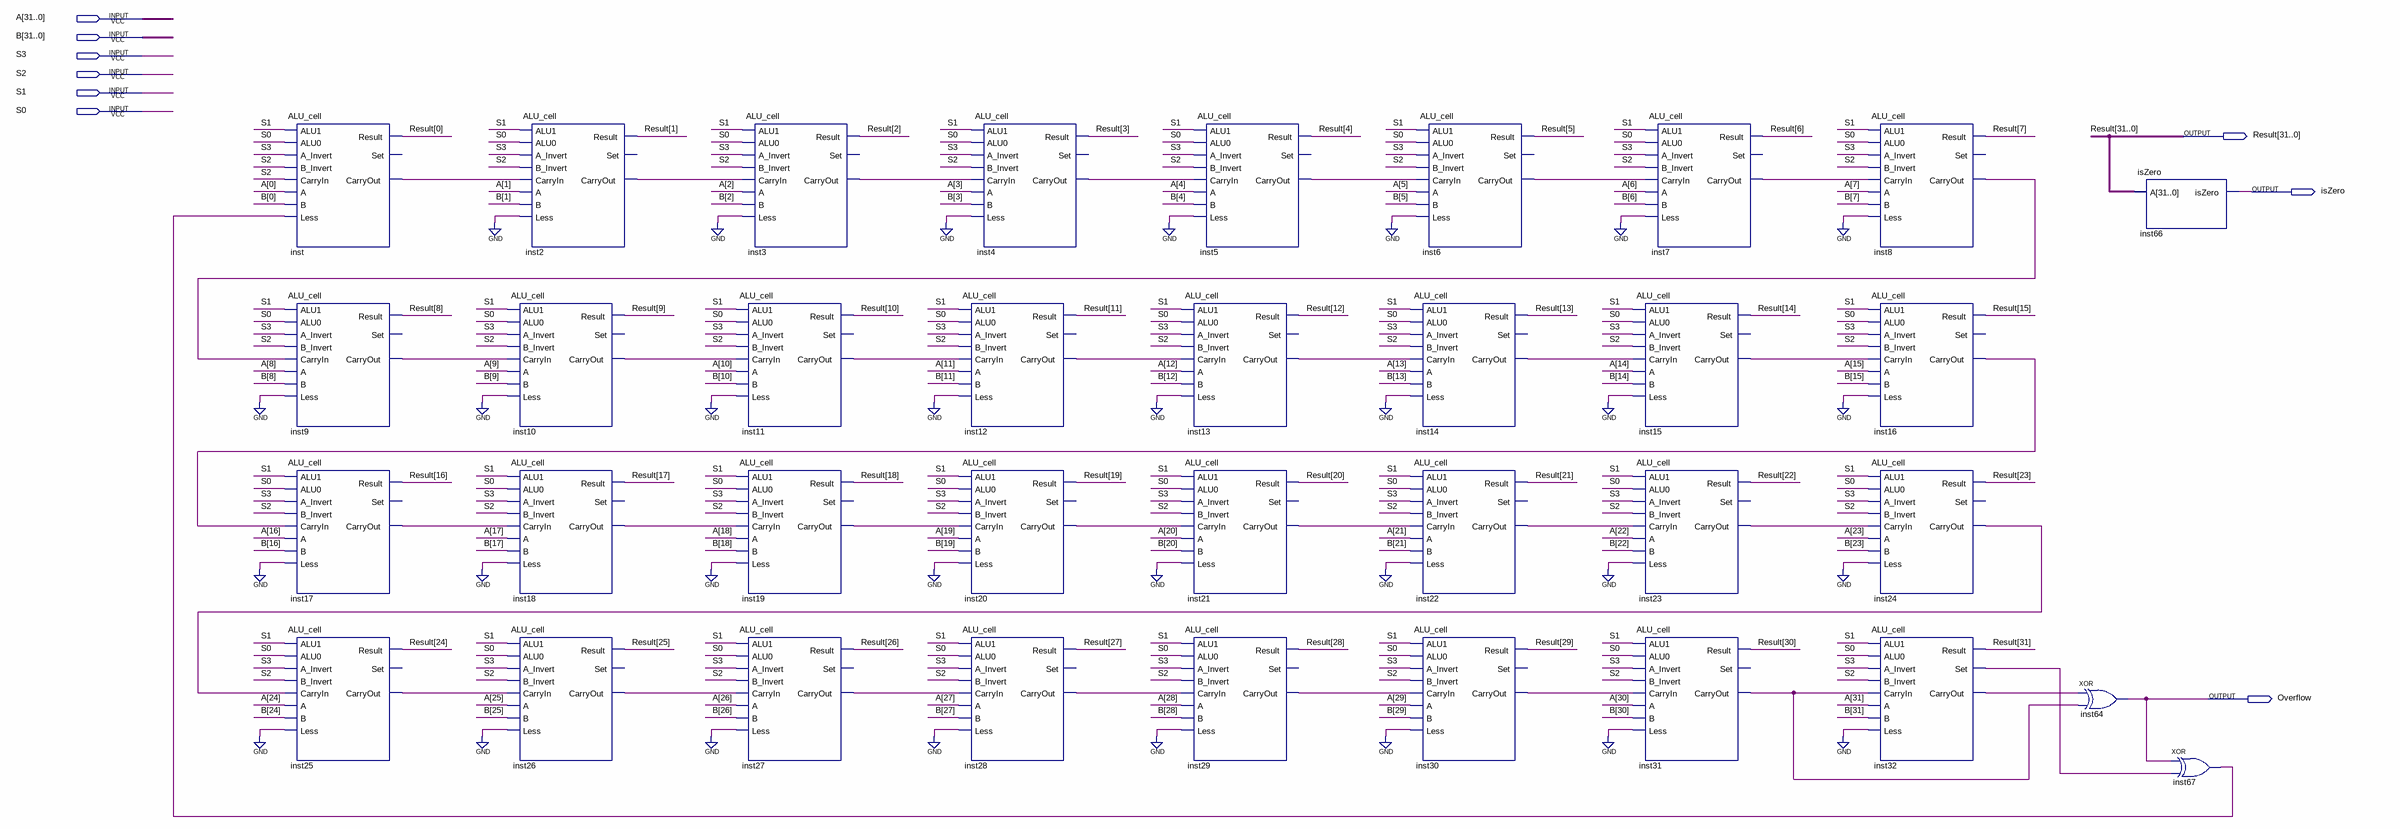
[diagram p0: schematic sheet]
// Quartus schematic ALU.bdf as structural Verilog: 35 symbols, 9 pins
module ALU (
  input  [31:0] A,
  input  [31:0] B,
  input  S3,
  input  S2,
  input  S1,
  input  S0,
  output [31:0] Result,
  output isZero,
  output Overflow
);

  wire inst2_carryout, inst3_carryout, inst4_carryout, inst5_carryout, inst6_carryout, inst7_carryout,
       inst8_carryout, inst9_carryout, inst10_carryout, inst11_carryout, inst12_carryout, inst13_carryout,
       inst14_carryout, inst15_carryout, inst16_carryout, inst17_carryout, inst18_carryout, inst19_carryout,
       inst20_carryout, inst21_carryout, inst22_carryout, inst23_carryout, inst24_carryout, inst25_carryout,
       inst26_carryout, inst27_carryout, inst28_carryout, inst29_carryout, inst30_carryout, inst31_carryout,
       inst32_carryout, inst32_set, inst67_out, inst_carryout;

  ALU_cell inst (
    .ALU1(S1), .A_Invert(S3), .ALU0(S0), .CarryIn(S2), .A(A[0]), .B_Invert(S2), .B(B[0]), .Less(inst67_out),
    .Result(Result[0]), .CarryOut(inst_carryout));  // open: Set
  ALU_cell inst9 (
    .ALU1(S1), .A_Invert(S3), .ALU0(S0), .CarryIn(inst8_carryout), .A(A[8]), .B_Invert(S2), .B(B[8]),
    .Less(1'b0), .Result(Result[8]), .CarryOut(inst9_carryout));  // open: Set
  ALU_cell inst17 (
    .ALU1(S1), .A_Invert(S3), .ALU0(S0), .CarryIn(inst16_carryout), .A(A[16]), .B_Invert(S2), .B(B[16]),
    .Less(1'b0), .Result(Result[16]), .CarryOut(inst17_carryout));  // open: Set
  ALU_cell inst25 (
    .ALU1(S1), .A_Invert(S3), .ALU0(S0), .CarryIn(inst24_carryout), .A(A[24]), .B_Invert(S2), .B(B[24]),
    .Less(1'b0), .Result(Result[24]), .CarryOut(inst25_carryout));  // open: Set
  ALU_cell inst10 (
    .ALU1(S1), .A_Invert(S3), .ALU0(S0), .CarryIn(inst9_carryout), .A(A[9]), .B_Invert(S2), .B(B[9]),
    .Less(1'b0), .Result(Result[9]), .CarryOut(inst10_carryout));  // open: Set
  ALU_cell inst18 (
    .ALU1(S1), .A_Invert(S3), .ALU0(S0), .CarryIn(inst17_carryout), .A(A[17]), .B_Invert(S2), .B(B[17]),
    .Less(1'b0), .Result(Result[17]), .CarryOut(inst18_carryout));  // open: Set
  ALU_cell inst26 (
    .ALU1(S1), .A_Invert(S3), .ALU0(S0), .CarryIn(inst25_carryout), .A(A[25]), .B_Invert(S2), .B(B[25]),
    .Less(1'b0), .Result(Result[25]), .CarryOut(inst26_carryout));  // open: Set
  ALU_cell inst2 (
    .ALU1(S1), .A_Invert(S3), .ALU0(S0), .CarryIn(inst_carryout), .A(A[1]), .B_Invert(S2), .B(B[1]),
    .Less(1'b0), .Result(Result[1]), .CarryOut(inst2_carryout));  // open: Set
  ALU_cell inst3 (
    .ALU1(S1), .A_Invert(S3), .ALU0(S0), .CarryIn(inst2_carryout), .A(A[2]), .B_Invert(S2), .B(B[2]),
    .Less(1'b0), .Result(Result[2]), .CarryOut(inst3_carryout));  // open: Set
  ALU_cell inst11 (
    .ALU1(S1), .A_Invert(S3), .ALU0(S0), .CarryIn(inst10_carryout), .A(A[10]), .B_Invert(S2), .B(B[10]),
    .Less(1'b0), .Result(Result[10]), .CarryOut(inst11_carryout));  // open: Set
  ALU_cell inst19 (
    .ALU1(S1), .A_Invert(S3), .ALU0(S0), .CarryIn(inst18_carryout), .A(A[18]), .B_Invert(S2), .B(B[18]),
    .Less(1'b0), .Result(Result[18]), .CarryOut(inst19_carryout));  // open: Set
  ALU_cell inst27 (
    .ALU1(S1), .A_Invert(S3), .ALU0(S0), .CarryIn(inst26_carryout), .A(A[26]), .B_Invert(S2), .B(B[26]),
    .Less(1'b0), .Result(Result[26]), .CarryOut(inst27_carryout));  // open: Set
  ALU_cell inst4 (
    .ALU1(S1), .A_Invert(S3), .ALU0(S0), .CarryIn(inst3_carryout), .A(A[3]), .B_Invert(S2), .B(B[3]),
    .Less(1'b0), .Result(Result[3]), .CarryOut(inst4_carryout));  // open: Set
  ALU_cell inst12 (
    .ALU1(S1), .A_Invert(S3), .ALU0(S0), .CarryIn(inst11_carryout), .A(A[11]), .B_Invert(S2), .B(B[11]),
    .Less(1'b0), .Result(Result[11]), .CarryOut(inst12_carryout));  // open: Set
  ALU_cell inst20 (
    .ALU1(S1), .A_Invert(S3), .ALU0(S0), .CarryIn(inst19_carryout), .A(A[19]), .B_Invert(S2), .B(B[19]),
    .Less(1'b0), .Result(Result[19]), .CarryOut(inst20_carryout));  // open: Set
  ALU_cell inst28 (
    .ALU1(S1), .A_Invert(S3), .ALU0(S0), .CarryIn(inst27_carryout), .A(A[27]), .B_Invert(S2), .B(B[27]),
    .Less(1'b0), .Result(Result[27]), .CarryOut(inst28_carryout));  // open: Set
  ALU_cell inst5 (
    .ALU1(S1), .A_Invert(S3), .ALU0(S0), .CarryIn(inst4_carryout), .A(A[4]), .B_Invert(S2), .B(B[4]),
    .Less(1'b0), .Result(Result[4]), .CarryOut(inst5_carryout));  // open: Set
  ALU_cell inst13 (
    .ALU1(S1), .A_Invert(S3), .ALU0(S0), .CarryIn(inst12_carryout), .A(A[12]), .B_Invert(S2), .B(B[12]),
    .Less(1'b0), .Result(Result[12]), .CarryOut(inst13_carryout));  // open: Set
  ALU_cell inst21 (
    .ALU1(S1), .A_Invert(S3), .ALU0(S0), .CarryIn(inst20_carryout), .A(A[20]), .B_Invert(S2), .B(B[20]),
    .Less(1'b0), .Result(Result[20]), .CarryOut(inst21_carryout));  // open: Set
  ALU_cell inst29 (
    .ALU1(S1), .A_Invert(S3), .ALU0(S0), .CarryIn(inst28_carryout), .A(A[28]), .B_Invert(S2), .B(B[28]),
    .Less(1'b0), .Result(Result[28]), .CarryOut(inst29_carryout));  // open: Set
  ALU_cell inst6 (
    .ALU1(S1), .A_Invert(S3), .ALU0(S0), .CarryIn(inst5_carryout), .A(A[5]), .B_Invert(S2), .B(B[5]),
    .Less(1'b0), .Result(Result[5]), .CarryOut(inst6_carryout));  // open: Set
  ALU_cell inst14 (
    .ALU1(S1), .A_Invert(S3), .ALU0(S0), .CarryIn(inst13_carryout), .A(A[13]), .B_Invert(S2), .B(B[13]),
    .Less(1'b0), .Result(Result[13]), .CarryOut(inst14_carryout));  // open: Set
  ALU_cell inst22 (
    .ALU1(S1), .A_Invert(S3), .ALU0(S0), .CarryIn(inst21_carryout), .A(A[21]), .B_Invert(S2), .B(B[21]),
    .Less(1'b0), .Result(Result[21]), .CarryOut(inst22_carryout));  // open: Set
  ALU_cell inst30 (
    .ALU1(S1), .A_Invert(S3), .ALU0(S0), .CarryIn(inst29_carryout), .A(A[29]), .B_Invert(S2), .B(B[29]),
    .Less(1'b0), .Result(Result[29]), .CarryOut(inst30_carryout));  // open: Set
  ALU_cell inst7 (
    .ALU1(S1), .A_Invert(S3), .ALU0(S0), .CarryIn(inst6_carryout), .A(A[6]), .B_Invert(S2), .B(B[6]),
    .Less(1'b0), .Result(Result[6]), .CarryOut(inst7_carryout));  // open: Set
  ALU_cell inst15 (
    .ALU1(S1), .A_Invert(S3), .ALU0(S0), .CarryIn(inst14_carryout), .A(A[14]), .B_Invert(S2), .B(B[14]),
    .Less(1'b0), .Result(Result[14]), .CarryOut(inst15_carryout));  // open: Set
  ALU_cell inst23 (
    .ALU1(S1), .A_Invert(S3), .ALU0(S0), .CarryIn(inst22_carryout), .A(A[22]), .B_Invert(S2), .B(B[22]),
    .Less(1'b0), .Result(Result[22]), .CarryOut(inst23_carryout));  // open: Set
  ALU_cell inst31 (
    .ALU1(S1), .A_Invert(S3), .ALU0(S0), .CarryIn(inst30_carryout), .A(A[30]), .B_Invert(S2), .B(B[30]),
    .Less(1'b0), .Result(Result[30]), .CarryOut(inst31_carryout));  // open: Set
  ALU_cell inst8 (
    .ALU1(S1), .A_Invert(S3), .ALU0(S0), .CarryIn(inst7_carryout), .A(A[7]), .B_Invert(S2), .B(B[7]),
    .Less(1'b0), .Result(Result[7]), .CarryOut(inst8_carryout));  // open: Set
  ALU_cell inst16 (
    .ALU1(S1), .A_Invert(S3), .ALU0(S0), .CarryIn(inst15_carryout), .A(A[15]), .B_Invert(S2), .B(B[15]),
    .Less(1'b0), .Result(Result[15]), .CarryOut(inst16_carryout));  // open: Set
  ALU_cell inst24 (
    .ALU1(S1), .A_Invert(S3), .ALU0(S0), .CarryIn(inst23_carryout), .A(A[23]), .B_Invert(S2), .B(B[23]),
    .Less(1'b0), .Result(Result[23]), .CarryOut(inst24_carryout));  // open: Set
  ALU_cell inst32 (
    .ALU1(S1), .A_Invert(S3), .ALU0(S0), .CarryIn(inst31_carryout), .A(A[31]), .B_Invert(S2), .B(B[31]),
    .Less(1'b0), .Result(Result[31]), .Set(inst32_set), .CarryOut(inst32_carryout));
  xor inst64 (Overflow, inst32_carryout, inst31_carryout);
  isZero inst66 (.A(Result), .isZero(isZero));
  xor inst67 (inst67_out, Overflow, inst32_set);
endmodule
